# EAGLE design LED Oscilloscope V2 (EAGLE 9.6.2)
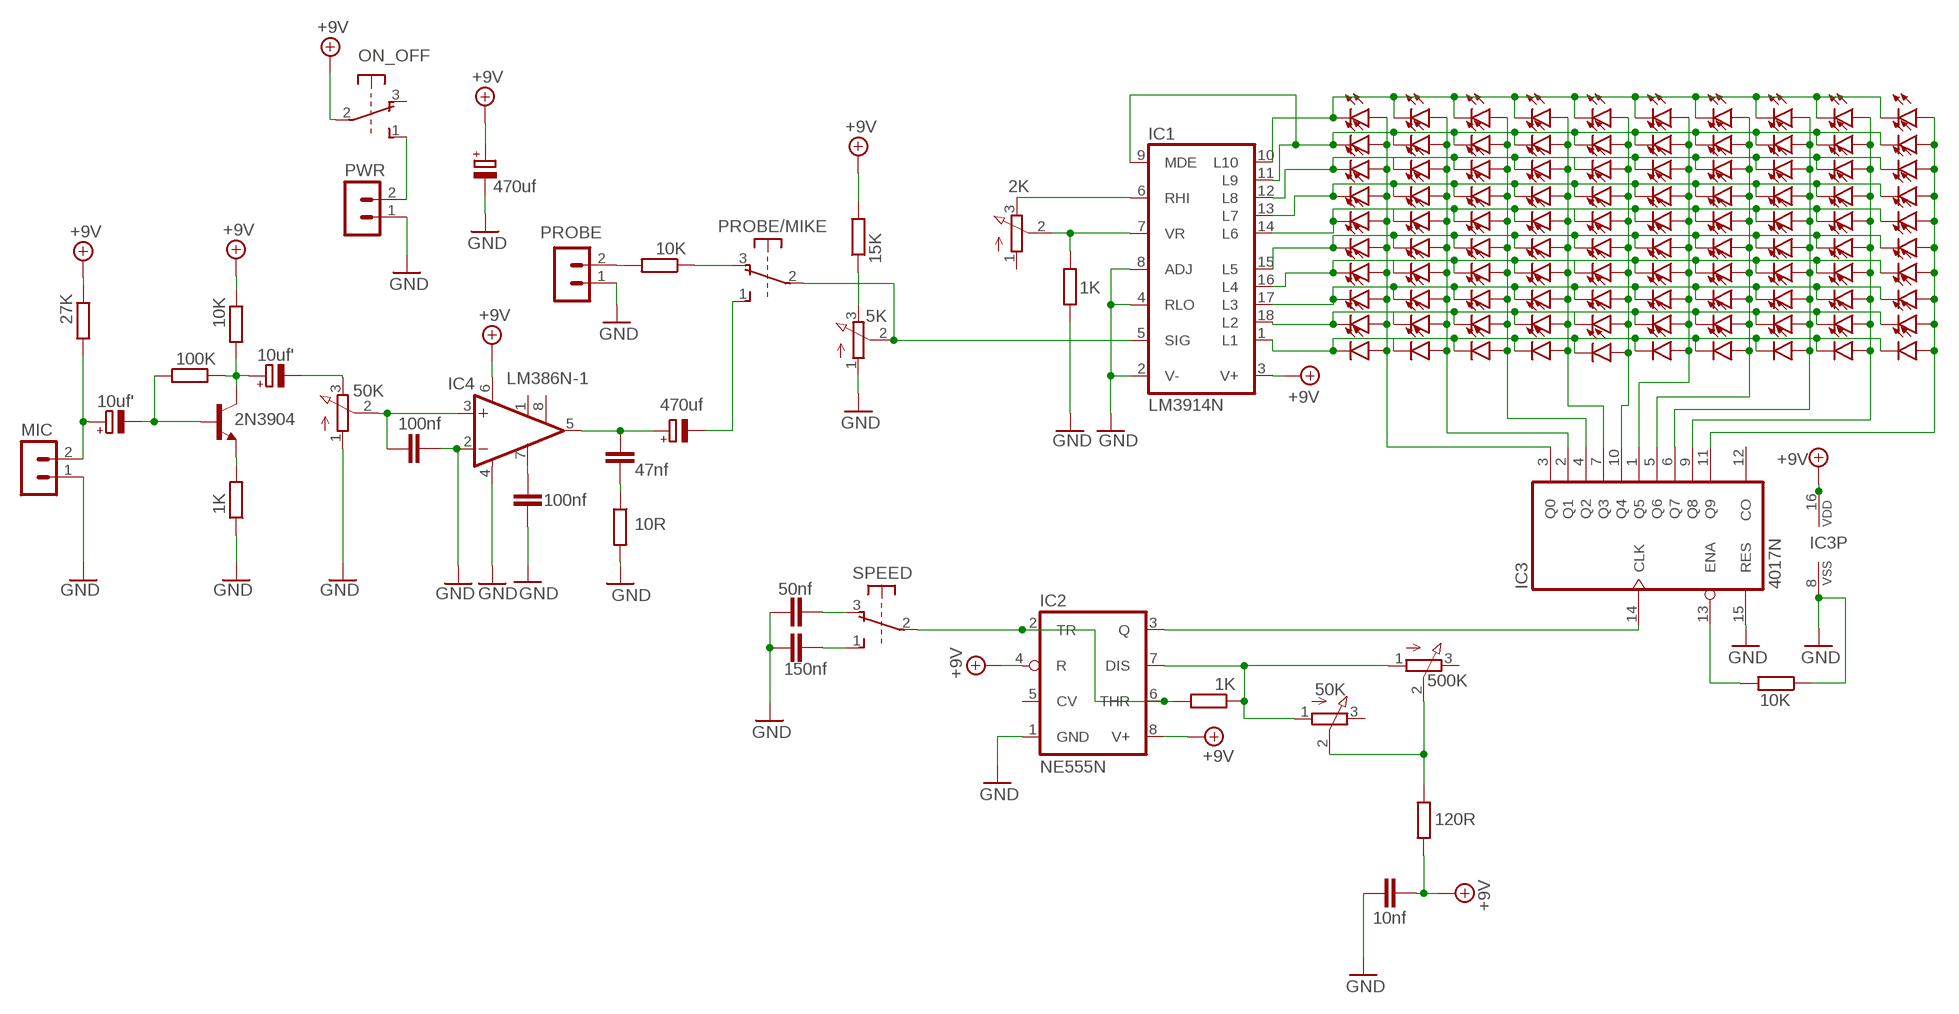
[diagram p0: schematic, sheet 1]

## Parts
C1  10nf  C-EU050-024X044  [C050-024X044]
C2  50nf  C-EU050-024X044  [C050-024X044]
C3  150nf  C-EU050-024X044  [C050-024X044]
C4  470uf  CPOL-EUE2.5-6  [E2,5-6]
C5  100nf  C-EU050-024X044  [C050-024X044]
C6  10uf'  CPOL-EUE2-5  [E2-5]
C7  10uf'  CPOL-EUE2-5  [E2-5]
C8  100nf  C-EU050-024X044  [C050-024X044]
C9  47nf  C-EU050-024X044  [C050-024X044]
C10  470uf  CPOL-EUE2.5-6  [E2,5-6]
FINE  2K  EVUF2A  [EVUF]
HOR_FINE  50K  EVUF2A  [EVUF]
HORIZONTAL  500K  EVUF2A  [EVUF]
IC1  LM3914N  [DIL18]
IC2  NE555N  [DIL08]
IC3  4017N  [DIL16]
IC4  LM386N-1  [DIL08]
LED1  LED5MM  [LED5MM]
LED2  LED5MM  [LED5MM]
LED3  LED5MM  [LED5MM]
LED4  LED5MM  [LED5MM]
LED5  LED5MM  [LED5MM]
LED6  LED5MM  [LED5MM]
LED7  LED5MM  [LED5MM]
LED8  LED5MM  [LED5MM]
LED9  LED5MM  [LED5MM]
LED10  LED5MM  [LED5MM]
LED11  LED5MM  [LED5MM]
LED12  LED5MM  [LED5MM]
LED13  LED5MM  [LED5MM]
LED14  LED5MM  [LED5MM]
LED15  LED5MM  [LED5MM]
LED16  LED5MM  [LED5MM]
LED17  LED5MM  [LED5MM]
LED18  LED5MM  [LED5MM]
LED19  LED5MM  [LED5MM]
LED20  LED5MM  [LED5MM]
LED21  LED5MM  [LED5MM]
LED22  LED5MM  [LED5MM]
LED23  LED5MM  [LED5MM]
LED24  LED5MM  [LED5MM]
LED25  LED5MM  [LED5MM]
LED26  LED5MM  [LED5MM]
LED27  LED5MM  [LED5MM]
LED28  LED5MM  [LED5MM]
LED29  LED5MM  [LED5MM]
LED30  LED5MM  [LED5MM]
LED31  LED5MM  [LED5MM]
LED32  LED5MM  [LED5MM]
LED33  LED5MM  [LED5MM]
LED34  LED5MM  [LED5MM]
LED35  LED5MM  [LED5MM]
LED36  LED5MM  [LED5MM]
LED37  LED5MM  [LED5MM]
LED38  LED5MM  [LED5MM]
LED39  LED5MM  [LED5MM]
LED40  LED5MM  [LED5MM]
LED41  LED5MM  [LED5MM]
LED42  LED5MM  [LED5MM]
LED43  LED5MM  [LED5MM]
LED44  LED5MM  [LED5MM]
LED45  LED5MM  [LED5MM]
LED46  LED5MM  [LED5MM]
LED47  LED5MM  [LED5MM]
LED48  LED5MM  [LED5MM]
LED49  LED5MM  [LED5MM]
LED50  LED5MM  [LED5MM]
LED51  LED5MM  [LED5MM]
LED52  LED5MM  [LED5MM]
LED53  LED5MM  [LED5MM]
LED54  LED5MM  [LED5MM]
LED55  LED5MM  [LED5MM]
LED56  LED5MM  [LED5MM]
LED57  LED5MM  [LED5MM]
LED58  LED5MM  [LED5MM]
LED59  LED5MM  [LED5MM]
LED60  LED5MM  [LED5MM]
LED61  LED5MM  [LED5MM]
LED62  LED5MM  [LED5MM]
LED63  LED5MM  [LED5MM]
LED64  LED5MM  [LED5MM]
LED65  LED5MM  [LED5MM]
LED66  LED5MM  [LED5MM]
LED67  LED5MM  [LED5MM]
LED68  LED5MM  [LED5MM]
LED69  LED5MM  [LED5MM]
LED70  LED5MM  [LED5MM]
LED71  LED5MM  [LED5MM]
LED72  LED5MM  [LED5MM]
LED73  LED5MM  [LED5MM]
LED74  LED5MM  [LED5MM]
LED75  LED5MM  [LED5MM]
LED76  LED5MM  [LED5MM]
LED77  LED5MM  [LED5MM]
LED78  LED5MM  [LED5MM]
LED79  LED5MM  [LED5MM]
LED80  LED5MM  [LED5MM]
LED81  LED5MM  [LED5MM]
LED82  LED5MM  [LED5MM]
LED83  LED5MM  [LED5MM]
LED84  LED5MM  [LED5MM]
LED85  LED5MM  [LED5MM]
LED86  LED5MM  [LED5MM]
LED87  LED5MM  [LED5MM]
LED88  LED5MM  [LED5MM]
LED89  LED5MM  [LED5MM]
LED90  LED5MM  [LED5MM]
LED91  LED5MM  [LED5MM]
LED92  LED5MM  [LED5MM]
LED93  LED5MM  [LED5MM]
LED94  LED5MM  [LED5MM]
LED95  LED5MM  [LED5MM]
LED96  LED5MM  [LED5MM]
LED97  LED5MM  [LED5MM]
LED98  LED5MM  [LED5MM]
LED99  LED5MM  [LED5MM]
LED100  LED5MM  [LED5MM]
MIC  B2B-PH-K-S  [B2B-PH-K-S]
ON_OFF  SWITCH-6PIN  [SWITCH-6PIN]
PROBE  B2B-PH-K-S  [B2B-PH-K-S]
PROBE/MIKE  SWITCH-6PIN  [SWITCH-6PIN]
PWR  B2B-PH-K-S  [B2B-PH-K-S]
R2  1K  R-EU_0207/10  [0207/10]
R3  1K  R-EU_0207/10  [0207/10]
R5  120R  R-EU_0207/10  [0207/10]
R7  15K  R-EU_0207/10  [0207/10]
R8  10K  R-EU_0207/10  [0207/10]
R9  10K  R-EU_0207/10  [0207/10]
R10  10R  R-EU_0207/10  [0207/10]
R11  10K  R-EU_0207/10  [0207/10]
R12  100K  R-EU_0207/10  [0207/10]
R13  1K  R-EU_0207/10  [0207/10]
R14  27K  R-EU_0207/10  [0207/10]
SPEED  SWITCH-6PIN  [SWITCH-6PIN]
STENGTH  50K  EVUF2A  [EVUF]
T1  2N3904  [TO92]
VERTICAL  5K  EVUF2A  [EVUF]

## Nets
+9V: C1.2 C4.+ IC1.3(V+) IC2.4(R) IC2.8(V+) IC3.16(VDD) IC4.6(VS) ON_OFF.2(1:P) R5.2 R7.2 R11.1 R14.1
GND: C1.1 C2.2 C3.2 C4.- C5.1 C8.2 IC1.2(V-) IC1.4(RLO) IC1.8(ADJ) IC2.1(GND) IC3.8(VSS) IC3.15(RES) IC4.2(-IN) IC4.4(GND) MIC.1 PROBE.1 PWR.1 R2.1 R9.1 R10.2 R13.1 STENGTH.1(A) VERTICAL.1(A)
N$1: FINE.2(S) IC1.7(VR) R2.2
N$2: FINE.3(E) IC1.6(RHI)
N$3: IC2.2(TR) IC2.6(THR) R3.2 SPEED.2(1:P)
N$5: HOR_FINE.2(S) HORIZONTAL.2(S) R5.1
N$6: C2.1 SPEED.3(1:O)
N$7: C3.1 SPEED.1(1:S)
N$8: PROBE/MIKE.3(1:O) R8.1
N$9: IC1.5(SIG) PROBE/MIKE.2(1:P) VERTICAL.2(S)
N$10: R7.1 VERTICAL.3(E)
N$11: PROBE.2 R8.2
N$12: IC1.10(L10) LED1.K(C) LED2.K(C) LED3.K(C) LED4.K(C) LED5.K(C) LED6.K(C) LED7.K(C) LED8.K(C) LED9.K(C) LED10.K(C)
N$13: IC1.9(MDE) IC1.11(L9) LED11.K(C) LED12.K(C) LED13.K(C) LED14.K(C) LED15.K(C) LED16.K(C) LED17.K(C) LED18.K(C) LED19.K(C) LED20.K(C)
N$14: IC1.12(L8) LED21.K(C) LED22.K(C) LED23.K(C) LED24.K(C) LED25.K(C) LED26.K(C) LED27.K(C) LED28.K(C) LED29.K(C) LED30.K(C)
N$15: IC1.13(L7) LED31.K(C) LED32.K(C) LED33.K(C) LED34.K(C) LED35.K(C) LED36.K(C) LED37.K(C) LED38.K(C) LED39.K(C) LED40.K(C)
N$16: IC1.14(L6) LED41.K(C) LED42.K(C) LED43.K(C) LED44.K(C) LED45.K(C) LED46.K(C) LED47.K(C) LED48.K(C) LED49.K(C) LED50.K(C)
N$17: IC1.15(L5) LED51.K(C) LED52.K(C) LED53.K(C) LED54.K(C) LED55.K(C) LED56.K(C) LED57.K(C) LED58.K(C) LED59.K(C) LED60.K(C)
N$18: IC1.16(L4) LED61.K(C) LED62.K(C) LED63.K(C) LED64.K(C) LED65.K(C) LED66.K(C) LED67.K(C) LED68.K(C) LED69.K(C) LED70.K(C)
N$19: IC1.17(L3) LED71.K(C) LED72.K(C) LED73.K(C) LED74.K(C) LED75.K(C) LED76.K(C) LED77.K(C) LED78.K(C) LED79.K(C) LED80.K(C)
N$20: IC1.18(L2) LED81.K(C) LED82.K(C) LED83.K(C) LED84.K(C) LED85.K(C) LED86.K(C) LED87.K(C) LED88.K(C) LED89.K(C) LED90.K(C)
N$21: IC1.1(L1) LED91.K(C) LED92.K(C) LED93.K(C) LED94.K(C) LED95.K(C) LED96.K(C) LED97.K(C) LED98.K(C) LED99.K(C) LED100.K(C)
N$22: IC3.3(Q0) LED1.A LED11.A LED21.A LED31.A LED41.A LED51.A LED61.A LED71.A LED81.A LED91.A
N$23: IC3.2(Q1) LED2.A LED12.A LED22.A LED32.A LED42.A LED52.A LED62.A LED72.A LED82.A LED92.A
N$24: IC3.4(Q2) LED3.A LED13.A LED23.A LED33.A LED43.A LED53.A LED63.A LED73.A LED83.A LED93.A
N$25: IC3.7(Q3) LED4.A LED14.A LED24.A LED34.A LED44.A LED54.A LED64.A LED74.A LED84.A LED94.A
N$26: IC3.10(Q4) LED5.A LED15.A LED25.A LED35.A LED45.A LED55.A LED65.A LED75.A LED85.A LED95.A
N$27: IC3.1(Q5) LED6.A LED16.A LED26.A LED36.A LED46.A LED56.A LED66.A LED76.A LED86.A LED96.A
N$28: IC3.5(Q6) LED7.A LED17.A LED27.A LED37.A LED47.A LED57.A LED67.A LED77.A LED87.A LED97.A
N$29: IC3.9(Q8) LED9.A LED19.A LED29.A LED39.A LED49.A LED59.A LED69.A LED79.A LED89.A LED99.A
N$30: IC3.6(Q7) LED8.A LED18.A LED28.A LED38.A LED48.A LED58.A LED68.A LED78.A LED88.A LED98.A
N$31: IC3.11(Q9) LED10.A LED20.A LED30.A LED40.A LED50.A LED60.A LED70.A LED80.A LED90.A LED100.A
N$32: IC2.3(Q) IC3.14(CLK)
N$33: C6.- STENGTH.3(E)
N$34: HOR_FINE.1(A) HORIZONTAL.1(A) IC2.7(DIS) R3.1
N$35: C5.2 IC4.3(+IN) STENGTH.2(S)
N$36: C6.+ R11.2 R12.2 T1.1(C)
N$37: C7.- R12.1 T1.2(B)
N$38: R13.2 T1.3(E)
N$39: C8.1 IC4.7(BYPASS)
N$40: C9.1 C10.+ IC4.5(OUT)
N$41: C9.2 R10.1
N$42: ON_OFF.1(1:S) PWR.2
N$43: C10.- PROBE/MIKE.1(1:S)
N$44: C7.+ MIC.2 R14.2
N$45: IC3.13(ENA) R9.2
Unconnected: FINE.1(A) HOR_FINE.3(E) HORIZONTAL.3(E) IC2.5(CV) IC3.12(CO) IC4.1(GAIN) IC4.8(GAIN) ON_OFF.3(1:O) ON_OFF.4(2:S) ON_OFF.5(2:P) ON_OFF.6(2:O) PROBE/MIKE.4(2:S) PROBE/MIKE.5(2:P) PROBE/MIKE.6(2:O) SPEED.4(2:S) SPEED.5(2:P) SPEED.6(2:O)

## Library data of the parts
C1-C3 C5 C8 C9 = rcl:C-EU: CAPACITOR, European symbol; SPICEPREFIX: C
C4 C6 C7 C10 = rcl:CPOL-EU: POLARIZED CAPACITOR, European symbol; SPICEPREFIX: C
FINE HOR_FINE HORIZONTAL STENGTH VERTICAL = pot:EVU: 9 mm Square Rotary Potentiometers Source: Panasonic
IC1 = linear:LM3914N: LED DRIVER senses analog voltage levels and drives 10 LEDs
IC2 = linear:*555: TIMER
IC3 = 40xx:4017: COUNTER/DIVIDER
IC4 = linear:LM386?-*: Low Voltage Audio Power Amplifier Source: http://cache.national.com/ds/LM/LM386.pdf
LED1-LED100 = led:LED: LED OSRAM: - CHIPLED LG R971, LG N971, LY N971, LG Q971, LY Q971, LO R971, LY R971 LH N974, LH R974 LS Q976, LO Q976, LY Q976 LO Q996 - Hyper CHIPLED LW Q18S LB Q993, LB Q99A, LB R99A - SideLED LS A670, LO A670, LY A670, LG A670, LP A670 LB A673, LV A673, LT A673, LW A673 LH A674 LY A675 LS A676, LA A676, LO A676, LY A676, LW A676 LS A679, LY A679, LG A679 - Hyper Micro SIDELED® LS Y876, LA Y876, LO Y876, LY Y876 LT Y87S - SmartLED LW L88C, LW L88S LB L89C, LB L89S, LG L890 LS L89K, LO L89K, LY L89K LS L896, LA L896, LO L896, LY L896 - TOPLED LS T670, LO T670, LY T670, LG T670, LP T670 LSG T670, LSP T670, LSY T670, LOP T670, LYG T670 LG T671, LOG T671, LSG T671 LB T673, LV T673, LT T673, LW T673 LH T674 LS T676, LA T676, LO T676, LY T676, LB T676, LH T676, LSB T676, LW T676 LB T67C, LV T67C, LT T67C, LS T67K, LO T67K, LY T67K, LW E67C LS E67B, LA E67B, LO E67B, LY E67B, LB E67C, LV E67C, LT E67C LW T67C LS T679, LY T679, LG T679 LS T770, LO T770, LY T770, LG T770, LP T770 LB T773, LV T773, LT T773, LW T773 LH T774 LS E675, LA E675, LY E675, LS T675 LS T776, LA T776, LO T776, LY T776, LB T776 LHGB T686 LT T68C, LB T68C - Hyper Mini TOPLED® LB M676 - Mini TOPLED Santana® LG M470 LS M47K, LO M47K, LY M47K Source: http://www.osram.convergy.de LUXEON: - LUMILED® LXK2-PW12-R00, LXK2-PW12-S00, LXK2-PW14-U00, LXK2-PW14-V00 LXK2-PM12-R00, LXK2-PM12-S00, LXK2-PM14-U00 LXK2-PE12-Q00, LXK2-PE12-R00, LXK2-PE12-S00, LXK2-PE14-T00, LXK2-PE14-U00 LXK2-PB12-K00, LXK2-PB12-L00, LXK2-PB12-M00, LXK2-PB14-N00, LXK2-PB14-P00, LXK2-PB14-Q00 LXK2-PR12-L00, LXK2-PR12-M00, LXK2-PR14-Q00, LXK2-PR14-R00 LXK2-PD12-Q00, LXK2-PD12-R00, LXK2-PD12-S00 LXK2-PH12-R00, LXK2-PH12-S00 LXK2-PL12-P00, LXK2-PL12-Q00, LXK2-PL12-R00 Source: www.luxeon.com KINGBRIGHT: KA-3528ASYC Source: www.kingbright.com
MIC PROBE PWR = con-JST PH:B2B-PH: JST PH series header 2.00mm pitch disconnectable crimp style connectors, vertical (side entry type), 2 pins
ON_OFF PROBE/MIKE SPEED = My Library:SWITCH-6PIN: ITT SWITCH
R2 R3 R5 R7-R14 = rcl:R-EU_: RESISTOR, European symbol; SPICEPREFIX: R
T1 = transistor-neu-to92:2N3904: NPN TRANSISTOR

## Board
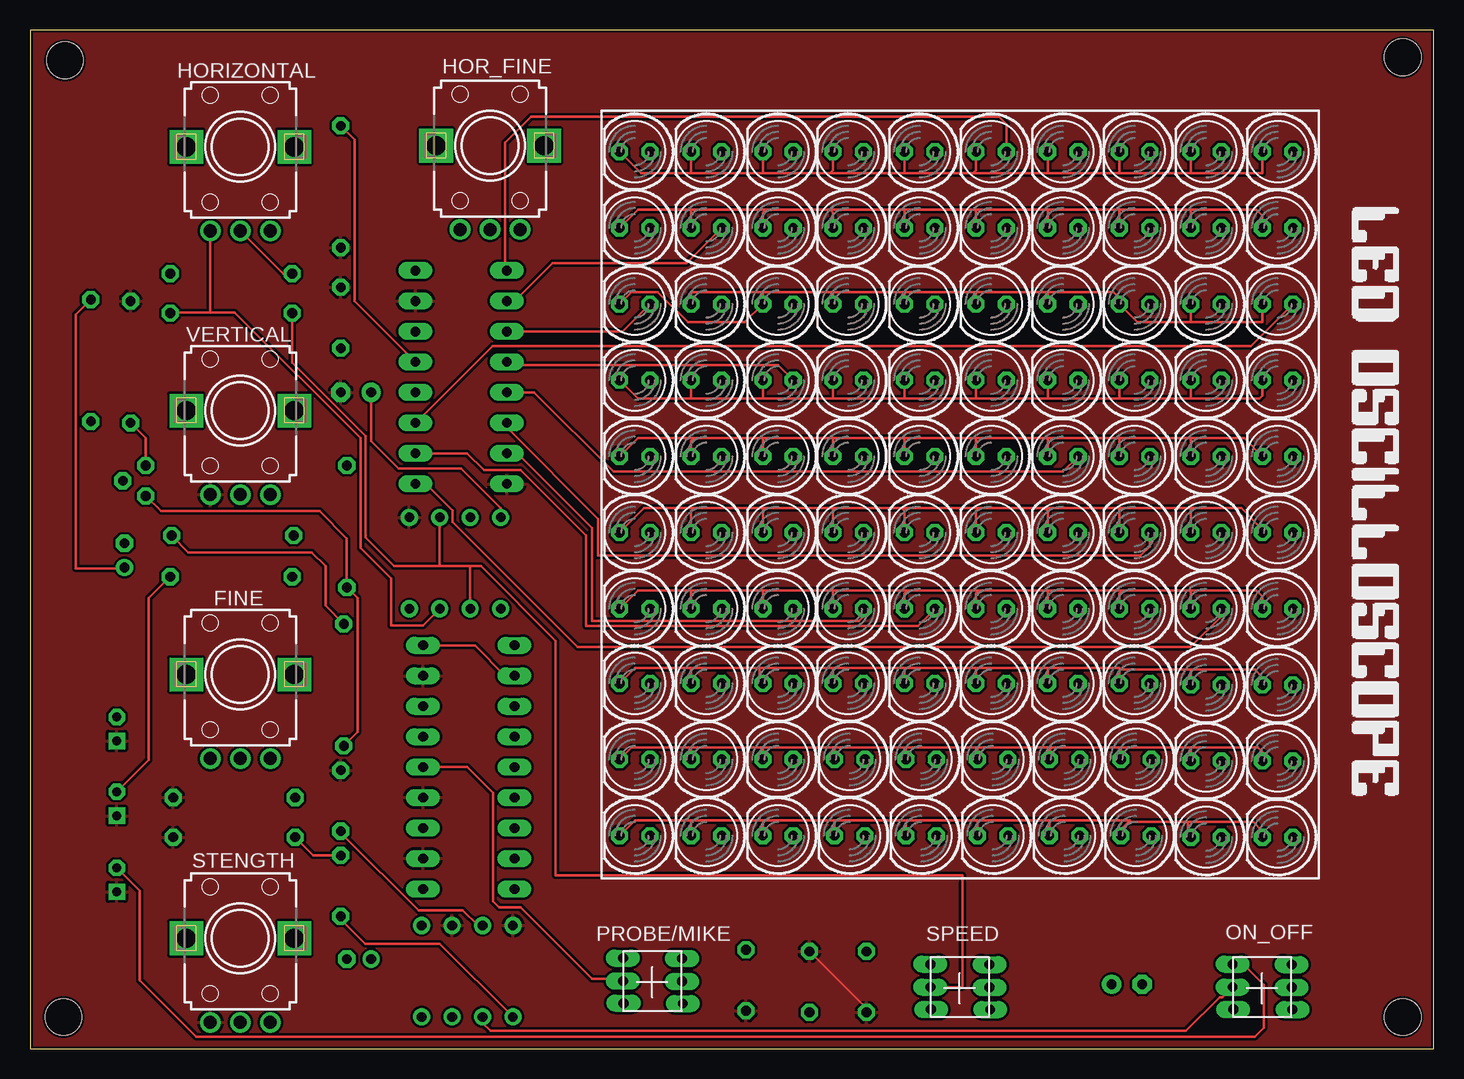
[diagram p1: board, top side]
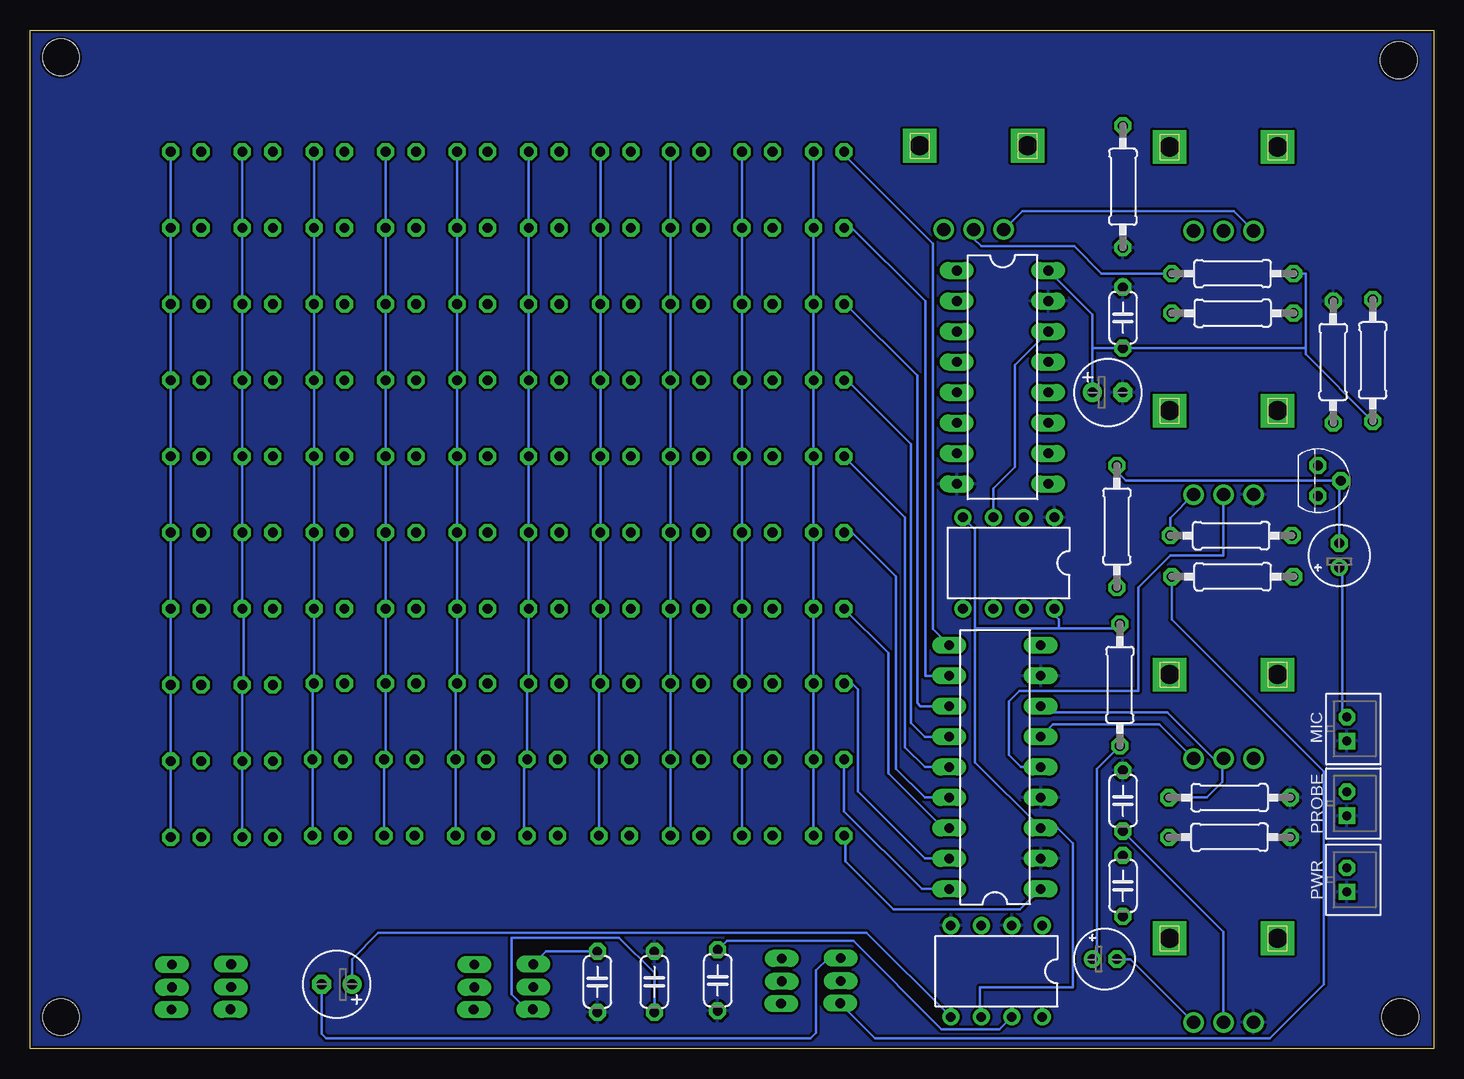
[diagram p2: board, bottom side, seen from below]

Size 117.02 x 84.95 mm. Coordinates in mm from the lower left corner, seen from the top.
Outline: 0,0 117.02,0 117.02,84.95 0,84.95 0,0
Copper layers (1*16): Top 0.035mm / dielectric 1.5mm / Bottom 0.035mm
Design rules "SparkFun": minimum track width 8mil, minimum drill 20mil, track to track 8mil, track to pad 8mil, pad to pad 8mil, via to via 8mil, smd to smd 8mil, copper to edge 8mil, drill to drill 8mil, minimum pad ring 12mil, minimum via ring 10mil, stop-mask expansion 4mil, vias tented up to drill 20mil, thermal gap 10mil
Holes 3.05 mm at 2.92,82.42 2.79,2.67 114.43,82.68 114.43,2.67

### Footprints (pad centres in the part's own frame; a part is rotated, then mirrored left to right if it is on the bottom)
C050-024X044 = drill 0.813 octagon: 1 -2.54,0; 2 2.54,0
E2,5-6 = drill 0.813 pad 1.6: + -1.27,0 | drill 0.813 pad 1.6 octagon: - 1.27,0
E2-5 = drill 0.813 pad 1.27: + -1.016,0 | drill 0.813 pad 1.27 octagon: - 1.016,0
EVUF = drill 1.1 pad 1.676: 1 -2.5,-7; 2 0,-7; 3 2.5,-7 | drill 1.6 pad 2.8 square: M1 4.5,0; M2 -4.5,0
DIL18 = drill 0.813 long: 1 -10.16,-3.81; 2 -7.62,-3.81; 3 -5.08,-3.81; 4 -2.54,-3.81; 5 0,-3.81; 6 2.54,-3.81; 7 5.08,-3.81; 8 7.62,-3.81; 9 10.16,-3.81; 10 10.16,3.81; 11 7.62,3.81; 12 5.08,3.81; 13 2.54,3.81; 14 0,3.81; 15 -2.54,3.81; 16 -5.08,3.81; 17 -7.62,3.81; 18 -10.16,3.81
DIL08 = drill 0.813 pad 1.27: 1 -3.81,-3.81; 2 -1.27,-3.81; 3 1.27,-3.81; 4 3.81,-3.81; 5 3.81,3.81; 6 1.27,3.81; 7 -1.27,3.81; 8 -3.81,3.81
DIL16 = drill 0.813 long: 1 -8.89,-3.81; 2 -6.35,-3.81; 3 -3.81,-3.81; 4 -1.27,-3.81; 5 1.27,-3.81; 6 3.81,-3.81; 7 6.35,-3.81; 8 8.89,-3.81; 9 8.89,3.81; 10 6.35,3.81; 11 3.81,3.81; 12 1.27,3.81; 13 -1.27,3.81; 14 -3.81,3.81; 15 -6.35,3.81; 16 -8.89,3.81
LED5MM = drill 0.813 octagon: A -1.27,0; K 1.27,0
B2B-PH-K-S = drill 0.75 pad 1.3 square: 1 1,0 | drill 0.75 pad 1.3 octagon: 2 -1,0
SWITCH-6PIN = drill 0.813 long: 1 -2.997,2.489; 2 -2.997,0.584; 3 -2.946,-1.27; 4 1.93,2.464; 5 1.93,0.559; 6 1.981,-1.295
0207/10 = drill 0.813 octagon: 1 -5.08,0; 2 5.08,0
TO92 = drill 0.813 octagon: 1 1.27,0; 2 0,1.905; 3 -1.27,0

### Placement (x,y rotation side)
C1  25.91,60.96 270 bottom
C2  64.97,5.59 90 bottom
C3  69.72,5.59 270 bottom
C4  27.18,54.74 0 bottom
C5  25.91,20.7 270 bottom
C6  27.43,7.49 0 bottom
C7  7.87,41.15 90 bottom
C8  59.69,5.71 270 bottom
C9  25.91,13.59 90 bottom
C10  91.44,5.38 180 bottom
FINE  17.53,31.22 0 top
HOR_FINE  38.35,75.31 0 top
HORIZONTAL  17.53,75.21 0 top
IC1  36.58,23.49 90 bottom
IC2  35.43,40.51 180 bottom
IC3  35.94,56.01 270 bottom
IC4  36.45,6.48 180 bottom
LED1  50.42,74.8 180 top
LED2  56.39,74.8 180 top
LED3  62.36,74.8 180 top
LED4  68.2,74.8 180 top
LED5  74.17,74.8 180 top
LED6  80.14,74.8 180 top
LED7  86.11,74.8 180 top
LED8  92.07,74.8 180 top
LED9  98.04,74.8 180 top
LED10  104.01,74.8 180 top
LED11  50.42,68.45 180 top
LED12  56.39,68.45 180 top
LED13  62.36,68.45 180 top
LED14  68.2,68.45 180 top
LED15  74.17,68.45 180 top
LED16  80.14,68.45 180 top
LED17  86.11,68.45 180 top
LED18  92.07,68.45 180 top
LED19  98.04,68.45 180 top
LED20  104.01,68.45 180 top
LED21  50.42,62.1 180 top
LED22  56.39,62.1 180 top
LED23  62.36,62.1 180 top
LED24  68.2,62.1 180 top
LED25  74.17,62.1 180 top
LED26  80.14,62.1 180 top
LED27  86.11,62.1 180 top
LED28  92.07,62.1 180 top
LED29  98.04,62.1 180 top
LED30  104.01,62.1 180 top
LED31  50.42,55.75 180 top
LED32  56.39,55.75 180 top
LED33  62.36,55.75 180 top
LED34  68.2,55.75 180 top
LED35  74.17,55.75 180 top
LED36  80.14,55.75 180 top
LED37  86.11,55.75 180 top
LED38  92.07,55.75 180 top
LED39  98.04,55.75 180 top
LED40  104.01,55.75 180 top
LED41  50.42,49.4 180 top
LED42  56.39,49.4 180 top
LED43  62.36,49.4 180 top
LED44  68.2,49.4 180 top
LED45  74.17,49.4 180 top
LED46  80.14,49.4 180 top
LED47  86.11,49.4 180 top
LED48  92.07,49.4 180 top
LED49  98.04,49.4 180 top
LED50  104.01,49.4 180 top
LED51  50.42,43.05 180 top
LED52  56.39,43.05 180 top
LED53  62.36,43.05 180 top
LED54  68.2,43.05 180 top
LED55  74.17,43.05 180 top
LED56  80.14,43.05 180 top
LED57  86.11,43.05 180 top
LED58  92.07,43.05 180 top
LED59  98.04,43.05 180 top
LED60  104.01,43.05 180 top
LED61  50.42,36.7 180 top
LED62  56.39,36.7 180 top
LED63  62.36,36.7 180 top
LED64  68.2,36.7 180 top
LED65  74.17,36.7 180 top
LED66  80.14,36.7 180 top
LED67  86.11,36.7 180 top
LED68  92.07,36.7 180 top
LED69  98.04,36.7 180 top
LED70  104.01,36.7 180 top
LED71  50.42,30.48 180 top
LED72  56.39,30.48 180 top
LED73  62.36,30.48 180 top
LED74  68.2,30.48 180 top
LED75  74.17,30.48 180 top
LED76  80.14,30.48 180 top
LED77  86.11,30.48 180 top
LED78  92.07,30.48 180 top
LED79  98.04,30.35 180 top
LED80  104.01,30.35 180 top
LED81  50.42,24.13 180 top
LED82  56.39,24.13 180 top
LED83  62.36,24.13 180 top
LED84  68.33,24.13 180 top
LED85  74.29,24.13 180 top
LED86  80.26,24.13 180 top
LED87  86.23,24.13 180 top
LED88  92.2,24.13 180 top
LED89  98.04,24 180 top
LED90  104.01,24 180 top
LED91  50.42,17.78 180 top
LED92  56.39,17.78 180 top
LED93  62.36,17.78 180 top
LED94  68.33,17.78 180 top
LED95  74.29,17.78 180 top
LED96  80.26,17.78 180 top
LED97  86.23,17.78 180 top
LED98  92.2,17.78 180 top
LED99  98.04,17.65 180 top
LED100  104.01,17.65 180 top
MIC  7.24,26.67 270 bottom
ON_OFF  103.25,4.57 0 top
PROBE  7.24,20.45 270 bottom
PROBE/MIKE  52.43,5.08 0 top
PWR  7.24,14.1 270 bottom
R2  17.02,20.95 180 bottom
R3  16.76,61.34 180 bottom
R5  16.76,64.64 0 bottom
R7  16.89,42.8 0 bottom
R8  16.76,39.37 0 bottom
R9  25.91,71.88 90 bottom
R10  17.02,17.65 0 bottom
R11  26.16,30.35 270 bottom
R12  26.42,43.56 270 bottom
R13  8.38,57.28 270 bottom
R14  5.08,57.4 90 bottom
SPEED  78.05,4.57 0 top
STENGTH  17.53,9.22 0 top
T1  9.65,47.37 270 bottom
VERTICAL  17.53,53.21 0 top

### Tracks (layer width: path | path; a pad name or v marks a point on that pad's centre or on a via)
+9V
  Top 0.203: R7.2 13.21,41.4 23.5,41.4 24.64,40.26 24.64,36.96 R11.1 | C4.+ 28.45,50.67 30.73,48.39 35.94,48.39 39.24,45.09 IC2.4 | ON_OFF.2 99.42,4.32 99.17,4.32 96.35,1.5 38.38,1.5 37.72,2.16 IC4.6
  Bottom 0.203: 10.67,58.42 10.67,57.91 R14.1 | R5.2 10.67,64.64 10.67,58.42 | 31.24,35.05 26.54,35.05 R11.1 | 28.45,58.42 28.45,61.21 IC3.16 | 28.45,58.42 C4.+ | 38.23,35.05 38.23,43.31 IC2.4 | 38.23,35.05 38.23,23.88 IC1.3 31.37,18.41 30.1,17.15 30.1,5.16 37.85,5.16 37.85,2.79 IC4.6 | IC2.8 31.62,36.2 31.24,35.81 31.24,35.05 | 31.24,35.05 38.23,35.05 | 10.67,58.42 C1.2 28.45,58.42
GND
  Top 0.203: C2.2 69.72,3.38 C3.2
  pour Top: 0,84.96 116.97,84.96 116.97,0 0,0
  pour Bottom: 0,84.96 116.97,84.96 116.97,0 0,0
N$1
  Bottom 0.203: FINE.2 17.63,24.11 17.63,23.48 | 17.63,23.48 17.63,22.24 18.92,20.95 R2.2 | IC1.7 32.26,28.07 22.23,28.07 17.63,23.48
N$2
  Bottom 0.203: FINE.3 22.86,27.05 31.75,27.05 IC1.6
N$3
  Top 0.203: SPEED.2 77.75,5.16 77.75,14.48 43.81,14.48 43.81,34.04 37.59,40.26 36.7,40.26 | 34.16,40.26 30.35,40.26 27.96,42.65 27.96,51.09 21.84,57.22 R3.2 | IC2.2 34.16,40.26 | 34.16,40.26 36.7,40.26 | 36.7,40.26 IC2.6
N$5
  Top 0.203: R5.1 21.09,64.64 HORIZONTAL.2
  Bottom 0.203: R5.1 27.69,64.64 29.97,66.93 37.72,66.93 38.35,67.56 HOR_FINE.2
N$6
  Bottom 0.203: C2.1 64.97,6.35 67.89,9.27 76.89,9.27 76.89,4.57 75.62,3.3 SPEED.3
N$7
  Bottom 0.203: SPEED.1 73.99,8.13 C3.1
N$8
  Bottom 0.203: R8.1 21.84,35.81 9.18,23.15 9.18,5.39 13.68,0.89 46.56,0.89 PROBE/MIKE.3
N$9
  Top 0.203: IC1.5 36.45,23.49 38.61,21.34 38.61,12.32 39.12,11.81 40.89,11.81 46.86,5.84 49.25,5.84 PROBE/MIKE.2
  Bottom 0.203: VERTICAL.2 17.53,41.15 21.97,41.15 24.64,38.48 24.64,29.84 34.54,29.84 35.43,28.96 35.43,24.51 34.42,23.49 IC1.5
N$10
  Bottom 0.203: VERTICAL.3 21.97,44.27 R7.1
N$11
  Top 0.203: R8.2 9.91,37.59 9.91,24.11 PROBE.2
N$12
  Top 0.203: LED1.K 50.93,73.02 55.12,73.02 | 55.12,73.02 61.09,73.02 | 61.09,73.02 66.67,73.02 | 66.67,73.02 72.9,73.02 | 72.9,73.02 78.61,73.02 | 78.61,73.02 84.84,73.02 | 84.84,73.02 90.8,73.02 | 90.8,73.02 96.77,73.02 | 96.77,73.02 102.74,73.02 LED10.K | LED9.K 96.77,73.02 | LED8.K 90.8,73.02 | LED7.K 84.84,73.02 | LED6.K 78.87,73.28 78.61,73.02 | LED5.K 72.9,73.02 | LED4.K 66.93,73.28 66.67,73.02 | LED3.K 61.09,73.02 | LED2.K 55.12,73.02
  Bottom 0.203: IC1.10 41.73,35 41.73,67.13 49.15,74.55 LED1.K
N$13
  Top 0.203: LED11.K 50.67,69.98 55.12,69.98 | 55.12,69.98 61.34,69.98 | 61.34,69.98 66.67,69.98 | 66.67,69.98 72.9,69.98 | 72.9,69.98 78.87,69.98 | 78.87,69.98 84.84,69.98 | 84.84,69.98 90.8,69.98 | 90.8,69.98 96.77,69.98 | 96.77,69.98 102.23,69.98 102.74,69.47 LED20.K | LED19.K 96.77,69.98 | LED18.K 90.8,69.98 | LED17.K 84.84,69.98 | LED16.K 78.87,69.98 | LED14.K 66.93,69.72 66.67,69.98 | LED15.K 72.9,69.98 | LED13.K 61.09,69.72 61.34,69.98 | LED12.K 55.12,69.98 | IC1.9 37.08,33.66 39.62,31.11 IC1.11
  Bottom 0.203: IC1.11 42.39,31.11 42.39,62.33 48.83,68.77 LED11.K
N$14
  Top 0.203: LED21.K 50.16,63.12 52.32,63.12 54.86,60.58 59.56,60.58 LED23.K 61.09,63.12 | 61.09,63.12 55.12,63.12 LED22.K | 61.09,63.12 66.93,63.12 | 66.93,63.12 72.9,63.12 | 72.9,63.12 78.87,63.12 | 78.87,63.12 84.84,63.12 | 84.84,63.12 90.3,63.12 90.8,62.61 LED28.K 92.33,60.58 96.77,60.58 | 96.77,60.58 102.74,60.58 LED30.K | LED29.K 96.77,60.58 | 84.84,63.12 LED27.K | 78.87,63.12 LED26.K | 72.9,63.12 LED25.K | 66.93,63.12 LED24.K
  Bottom 0.203: IC1.12 42.8,28.58 43.05,28.83 43.05,56.13 49.02,62.1 LED21.K
N$15
  Top 0.203: LED31.K 50.67,54.23 55.12,54.23 | 55.12,54.23 61.09,54.23 | 78.87,54.23 84.84,54.23 | 84.84,54.23 90.8,54.23 | 90.8,54.23 96.77,54.23 | 96.77,54.23 102.49,54.23 102.74,54.48 LED40.K | LED39.K 96.77,54.23 | LED38.K 90.8,54.23 | LED37.K 84.84,54.23 | LED36.K 78.87,54.23 | LED33.K 61.09,54.23 | LED32.K 55.12,54.23 | 61.09,54.23 66.93,54.23 | 66.93,54.23 72.9,54.23 | 72.9,54.23 78.87,54.23 | LED34.K 66.93,54.23 | LED35.K 72.9,54.23
  Bottom 0.203: IC1.13 42.42,26.04 43.56,27.18 43.56,50.42 48.9,55.75 LED31.K
N$16
  Top 0.203: LED41.K 50.67,50.93 55.37,50.93 | 55.37,50.93 61.09,50.93 | 61.09,50.93 66.93,50.93 | 66.93,50.93 72.9,50.93 | 72.9,50.93 78.87,50.93 | 78.87,50.93 84.84,50.93 | 84.84,50.93 90.8,50.93 | LED48.K 90.8,50.93 | LED47.K 84.84,50.93 | LED46.K 78.87,50.93 | LED45.K 72.9,50.93 | LED44.K 66.93,50.93 | LED43.K 61.09,50.93 | LED42.K 55.12,50.67 55.37,50.93 | LED50.K 101.22,50.93 96.77,50.93 | 90.8,50.93 96.77,50.93 | LED49.K 96.77,50.93
  Bottom 0.203: IC1.14 42.42,23.49 44.07,25.15 44.07,44.32 LED41.K
N$17
  Top 0.203: LED51.K 51.18,45.09 55.37,45.09 | 55.37,45.09 61.09,45.09 | 61.09,45.09 66.93,45.09 | 66.93,45.09 72.64,45.09 | 72.64,45.09 79.12,45.09 | 79.12,45.09 84.58,45.09 | 84.58,45.09 90.8,45.09 | 90.8,45.09 96.77,45.09 | 96.77,45.09 100.96,45.09 102.74,43.31 LED60.K | LED59.K 96.77,45.09 | LED58.K 90.8,45.09 | LED57.K 84.84,44.83 84.58,45.09 | LED56.K 78.87,44.83 79.12,45.09 | LED55.K 72.9,44.83 72.64,45.09 | LED54.K 66.93,45.09 | LED53.K 61.09,45.09 | LED52.K 55.12,44.83 55.37,45.09
  Bottom 0.203: IC1.15 42.42,20.95 44.83,23.37 44.83,39.37 48.51,43.05 LED51.K
N$18
  Top 0.203: LED61.K 50.67,38.23 55.12,38.23 | 55.12,38.23 61.09,38.23 | 61.09,38.23 66.93,38.23 | 66.93,38.23 73.15,38.23 | 73.15,38.23 79.12,38.23 | 79.12,38.23 84.84,38.23 | 84.84,38.23 91.06,38.23 | 91.06,38.23 96.77,38.23 | 96.77,38.23 102.23,38.23 102.74,37.72 LED70.K | LED69.K 96.77,38.23 | LED68.K 90.8,37.97 91.06,38.23 | LED67.K 84.84,38.23 | LED66.K 78.87,37.97 79.12,38.23 | LED65.K 72.9,37.97 73.15,38.23 | LED64.K 66.93,38.23 | LED63.K 61.09,38.23 | LED62.K 55.12,38.23
  Bottom 0.203: IC1.16 40.89,18.41 45.47,22.99 45.47,33.02 LED61.K
N$19
  Top 0.203: LED71.K 50.42,31.75 55.12,31.75 | 55.12,31.75 60.83,31.75 | 60.83,31.75 66.93,31.75 | 66.93,31.75 72.9,31.75 | 72.9,31.75 78.87,31.75 | 78.87,31.75 84.84,31.75 | 84.84,31.75 90.8,31.75 90.8,31.62 | 90.8,31.62 96.77,31.62 | 96.77,31.62 102.11,31.62 102.74,30.99 LED80.K | LED79.K 96.77,31.62 | LED77.K 84.84,31.75 | LED76.K 78.87,31.75 | LED75.K 72.9,31.75 | LED74.K 66.93,31.75 | LED73.K 60.83,30.73 60.83,31.75 | LED72.K 55.12,31.75 | LED78.K 90.8,31.62
  Bottom 0.203: LED71.K 48.51,30.48 48.01,29.97 48.01,21.46 42.42,15.88 IC1.17
N$20
  Top 0.203: LED81.K 50.16,25.15 55.12,25.15 | 55.12,25.15 61.09,25.15 | 61.09,25.15 67.06,25.15 | 67.06,25.15 73.02,25.15 | 73.02,25.15 78.99,25.15 | 78.99,25.15 85.22,25.15 | 85.22,25.15 90.93,25.15 | 90.93,25.15 96.77,25.15 | 96.77,25.15 102.36,25.15 102.74,24.77 LED90.K | LED89.K 96.77,25.15 | LED88.K 90.93,25.15 | LED87.K 84.96,24.89 85.22,25.15 | LED86.K 78.99,25.15 | LED85.K 73.02,25.15 | LED84.K 67.06,25.15 | LED83.K 61.09,25.15 | LED82.K 55.12,25.15
  Bottom 0.203: LED81.K 49.15,19.81 42.67,13.33 IC1.18
N$21
  Top 0.203: LED91.K 50.42,19.05 54.99,19.05 | 54.99,19.05 61.09,19.05 | 61.09,19.05 67.06,19.05 | 67.06,19.05 73.28,19.05 | 73.28,19.05 78.99,19.05 | 78.99,19.05 84.96,19.05 | 84.96,19.05 91.69,19.05 91.57,18.92 | 91.57,18.92 96.52,18.92 | 96.52,18.92 101.98,18.92 102.74,18.16 LED100.K | LED99.K 96.52,17.91 96.52,18.92 | LED98.K 90.93,18.29 91.57,18.92 | LED97.K 84.96,19.05 | LED96.K 78.99,19.05 | LED95.K 73.02,18.8 73.28,19.05 | LED94.K 67.06,19.05 | LED93.K 61.09,19.05 | LED92.K 55.12,18.92 54.99,19.05
  Bottom 0.203: IC1.1 34.48,11.62 45.02,11.62 49.02,15.62 49.02,17.65 LED91.K
N$22
  Top 0.203: LED21.A 49.4,59.82 IC3.3
  Bottom 0.203: LED1.A LED11.A LED21.A LED31.A LED41.A LED51.A LED61.A LED71.A LED81.A LED91.A
N$23
  Top 0.203: LED12.A 54.74,65.53 43.56,65.53 40.39,62.36 IC3.2
  Bottom 0.203: LED2.A LED12.A LED22.A LED32.A LED42.A LED52.A LED62.A LED72.A LED82.A LED92.A
N$24
  Top 0.203: IC3.4 40.01,57.02 62.36,57.02 LED33.A
  Bottom 0.203: LED3.A LED13.A LED23.A LED33.A LED43.A LED53.A LED63.A LED73.A LED83.A LED93.A
N$25
  Top 0.203: IC3.7 40.64,49.66 46.86,43.43 46.86,35.69 69.09,35.69 69.47,36.07 LED64.A
  Bottom 0.203: LED4.A LED14.A LED34.A | LED24.A LED34.A | LED34.A LED44.A LED54.A LED64.A LED74.A 69.6,30.35 LED84.A LED94.A
N$26
  Top 0.203: IC3.10 36.45,49.66 37.85,48.26 40.89,48.26 46.36,42.8 46.36,35.28 74.02,35.28 LED65.A
  Bottom 0.203: LED5.A LED15.A LED25.A LED35.A LED45.A LED55.A LED65.A LED75.A 75.56,30.35 LED85.A 75.82,23.88 75.82,18.03 LED95.A
N$27
  Top 0.203: LED6.A 81.41,77.09 80.77,77.72 41.78,77.72 39.62,75.56 39.62,65.02 IC3.1
  Bottom 0.203: LED6.A LED16.A LED26.A LED36.A LED46.A LED56.A LED66.A LED76.A 81.53,30.35 LED86.A LED96.A
N$28
  Top 0.203: IC3.5 42.04,54.74 48.64,48.13 86.11,48.13 LED47.A
  Bottom 0.203: LED7.A LED17.A LED27.A LED37.A LED47.A LED57.A LED67.A LED77.A 87.38,24.26 LED87.A LED97.A
N$29
  Top 0.203: IC3.9 32.56,47.55 35.21,44.9 35.21,43.95 45.65,33.5 96.75,33.5 99.31,36.07 LED69.A
  Bottom 0.203: LED9.A LED19.A LED29.A LED39.A LED49.A LED59.A LED69.A 99.19,36.58 99.19,31.11 98.93,30.86 98.93,30.73 LED79.A LED89.A LED99.A
N$30
  Top 0.203: IC3.6 39.75,51.82 47.37,44.2 47.37,41.15 92.58,41.15 93.34,41.91 LED58.A
  Bottom 0.203: LED8.A LED18.A LED28.A LED38.A LED48.A LED58.A LED68.A LED78.A 93.47,30.35 LED88.A LED98.A
N$31
  Top 0.203: IC3.11 38.54,58.61 101.79,58.61 LED30.A
  Bottom 0.203: LED10.A LED20.A 105.28,62.86 105.54,62.61 105.54,62.36 LED30.A LED40.A 105.28,49.66 105.79,49.15 105.54,49.15 LED50.A LED60.A LED70.A LED80.A LED90.A LED100.A
N$32
  Bottom 0.203: IC2.3 36.7,46.74 34.92,48.51 34.92,57.02 IC3.14
N$33
  Bottom 0.203: STENGTH.3 25.3,7.49 C6.-
N$34
  Top 0.203: 15.03,61.41 11.75,61.41 R3.1 | 15.03,61.41 17.08,61.41 27.56,50.93 27.56,41.78 30.1,39.24 30.1,35.31 32.77,35.31 IC2.7 | HORIZONTAL.1 15.03,61.41
  Bottom 0.203: HORIZONTAL.1 16.67,69.85 34.29,69.85 35.83,68.31 HOR_FINE.1
N$35
  Top 0.203: C5.2 26.16,17.91 26.16,17.78 32.38,11.56 36.07,11.56 37.34,10.29 IC4.3
  Bottom 0.203: C5.2 17.53,9.78 STENGTH.2
N$36
  Top 0.203: T1.1 10.92,44.83 24.13,44.83 26.42,42.55 R12.2 27.3,37.59 27.3,26.42 R11.2
  Bottom 0.203: C6.+ 28.07,7.87 28.07,23.37 R11.2
N$37
  Bottom 0.203: C7.- 7.87,47.24 T1.2 14.54,47.37 14.55,47.37 25.66,47.37 26.42,48.13 R12.1
N$38
  Top 0.203: R13.2 9.65,50.93 T1.3
N$39
  Bottom 0.203: C8.1 58.93,9.02 48.39,9.02 41.02,1.65 36.2,1.65 IC4.7
N$40
  Top 0.203: IC4.5 34.16,8.76 27.94,8.76 25.91,10.79 C9.1
  Bottom 0.203: IC4.5 47.27,9.68 87.99,9.68 90.17,7.49 C10.+
N$41
  Top 0.203: C9.2 23.62,16.13 R10.1
N$42
  Top 0.203: PWR.2 9.14,13.19 9.14,5.71 13.84,1.02 102.11,1.02 102.87,1.78 102.87,5.33 101.14,7.06 ON_OFF.1
N$43
  Bottom 0.203: PROBE/MIKE.1 50.47,7.57 51.5,6.54 51.5,1.33 51.94,0.89 92.33,0.89 92.71,1.27 C10.-
N$44
  Top 0.203: R14.2 3.81,61.21 3.81,40.06 7.8,40.06 C7.+
  Bottom 0.203: C7.+ 7.62,39.88 7.62,28.05 MIC.2
N$45
  Top 0.203: IC3.13 27.05,62.36 27.05,75.82 R9.2